# Altium schematic sheet Load11.SchDoc
size A4; SheetNumber: 14; SheetTotal: 15
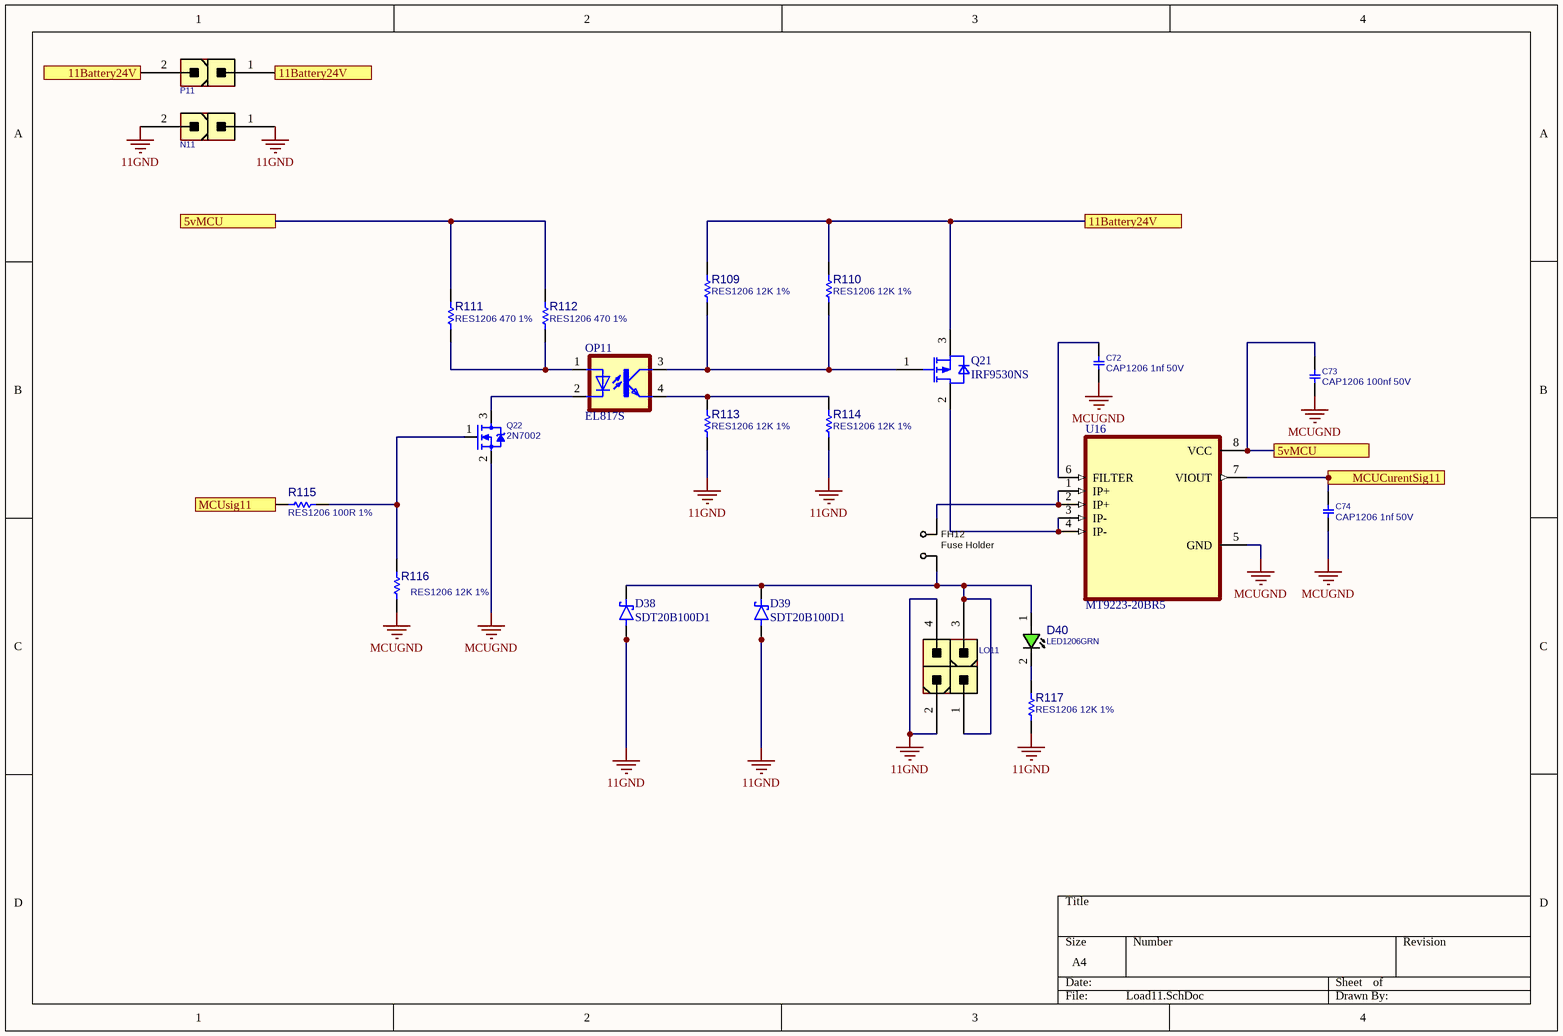
[diagram p0: Load11.SchDoc]

## Parts
C72  CAP1206 1nf 50V  [C1206]
C73  CAP1206 100nf 50V  [C1206]
C74  CAP1206 1nf 50V  [C1206]
D38  SDT20B100D1  [DPAK229P990X238-3N]
D39  SDT20B100D1  [DPAK229P990X238-3N]
D40  LED1206GRN  [LED1206GRN]
FH12  Fuse Holder  [FH_24101812]
LO11  CONN_ATXPWR_4  [ATXPWR_4]  (value not drawn)
N11  CONN_ATXPWR_2  [ATXPWR_2]  (value not drawn)
OP11  EL817S  [SOIC254P1030X460-4N]
P11  CONN_ATXPWR_2  [ATXPWR_2]  (value not drawn)
Q21  IRF9530NS  [TO254P1528X508-4_3N-V1]
Q22  2N7002  [SOT23_3]
R109  RES1206 12K 1%  [R1206]
R110  RES1206 12K 1%  [R1206]
R111  RES1206 470 1%  [R1206]
R112  RES1206 470 1%  [R1206]
R113  RES1206 12K 1%  [R1206]
R114  RES1206 12K 1%  [R1206]
R115  RES1206 100R 1%  [R1206]
R116  RES1206 12K 1%  [R1206]
R117  RES1206 12K 1%  [R1206]
U16  MT9223-20BR5  [SOIC127P600X175-8N]

## Ports
5vMCU, 11Battery24V, MCUCurentSig11, MCUsig11

## Nets
11GND: D38.1(A) D38.3(A__1) D39.1(A) D39.3(A__1) LO11.2 LO11.4 N11.1 N11.2 R113.2 R114.2 R117.2
MCUGND: C72.2 C73.2 C74.2 Q22.2(SOURCE) R116.2 U16.5(GND)
5vMCU: C73.1 R111.2 R112.2 U16.8(VCC) ; port 5vMCU
11Battery24V: P11.1 P11.2 Q21.3(SOURCE) R109.1 R110.1 ; port 11Battery24V
MCUCurentSig11: C74.1 U16.7(VIOUT) ; port MCUCurentSig11
MCUsig11: R115.1 ; port MCUsig11
NetC72_1: C72.1 U16.6(FILTER)
NetD38_4: D38.4(K) D39.4(K) D40.1(ANODE) FH12.1 LO11.1 LO11.3
NetD40_2: D40.2(CATHODE) R117.1
NetFH12_2: FH12.2 U16.1(IP+) U16.2(IP+)
NetOP11_1: OP11.1(A) R111.1 R112.1
NetOP11_2: OP11.2(C) Q22.3(DRAIN)
NetOP11_3: OP11.3(COL) Q21.1(GATE) R109.2 R110.2
NetOP11_4: OP11.4(EMIT) R113.1 R114.1
NetQ21_2: Q21.2(DRAIN) U16.3(IP-) U16.4(IP-)
NetQ22_1: Q22.1(GATE) R115.2 R116.1

## Library data of the parts
C72-C74 = CAP_SMD_MLCC_1206: CAP, MLCC; PARAM: -, -%; MANF_P#: MANF_PART#; PARAM2: -V; PRICE: 100= 1$; MANF: -; ASSEMBLY: ASSEMBLY
D38 D39 = MBRD835L: Diode Schottky 35 V 8A Surface Mount DPAK; MF: ON Semiconductor; SnapEDA_Link: https://www.snapeda.com/parts/MBRD835L/Onsemi/view-part/?ref=snap; Package: TO-252-3 MICROSS/On Semiconductor; Value: *; MP: MBRD835L; Check_prices: https://www.snapeda.com/parts/MBRD835L/Onsemi/view-part/?ref=eda
D40 = LED_SMD_1206_GRN: LED, SMD, 1206, GREEN; PARAM: 20mA; DESC: DESCRIPTION; PARAM2: 2.2V; MANF: -; ASSEMBLY: ASSEMBLY; PRICE: 36t@Javan; MANF_P#: -; VALUE: LED1206GRN; MountType: SMT; PartType: LED
FH12 = FUSE_SMD_HOLDER_24101812: Fuse SMD2410 Holder; PARAM: max. 10A; MANF: Littelfuse; MANF_P#: 01550900M; PARAM2: 125v; PRICE: 0.2$; PACKAGE: SMD,5.0x9.7mm; VALUE: Fuse Holder
LO11 = CONN_ATXPWR_4: CONN, ATX POWER, 4 P; MANF: TE, Molex; MANF_P#: 4-1775099-0, 39281043; VALUE: CONN_ATXPWR_4; MountType: THD; PACKAGE: ATXPWR-4pin; Part Type: Conn.
N11 P11 = CONN_ATXPWR_2: CONN, ATX POWER, 2 P; MANF: Molex; MANF_P#: 39281023; VALUE: CONN_ATXPWR_2; MountType: THD; PACKAGE: ATXPWR-2pin; Part Type: Conn.
OP11 = EL817S: Optoisolator Transistor Output 5000Vrms 1 Channel 4-SMD; MF: Everlight Electronics; SnapEDA_Link: https://www.snapeda.com/parts/EL817S/Everlight+Electronics+Co+Ltd/view-part/?ref=snap; Package: SMD-4 Everlight Electronics Co Ltd; Value: *; MP: EL817S; Check_prices: https://www.snapeda.com/parts/EL817S/Everlight+Electronics+Co+Ltd/view-part/?ref=eda
Q21 = IRF9530NS: OptiMOS - P2 Power-Transistor, P-channel-Enhancement mode, VDS -30V; Manufacturer: Infineon Technologies; Manufacturer Order NumberManufacturer Order Number: IRF9530NS; PackageReference: PG-TO263-3-901
Q22 = MOSN_2N7002_SOT23: MOSFET, N-CH, 60V, 0.3A; MANF: NXP; ASSEMBLY: ASSEMBLY; MANF_P#: 2N7002; PARAM2: 60v; PARAM: 0.3A; PRICE: 0.3t@Javan; VALUE: 2N7002
R109-R117 = RES_SMD_1206: RESISTOR, SMD; PARAM: 1%, 0.25W; DESC: DESCRIPTION; DIST#: MOUSER; MANF_P#: -; MANF: -; ASSEMBLY: ASSEMBLY; PRICE: -; PARAM2: -
U16 = ACS712ELCTR-05B-T: MF: {'manufacturer': u'Allegro MicroSystems'}; Package: None; Price: None; Value: *; MP: ACS712ELCTR-05B-T; Availability: Unavailable